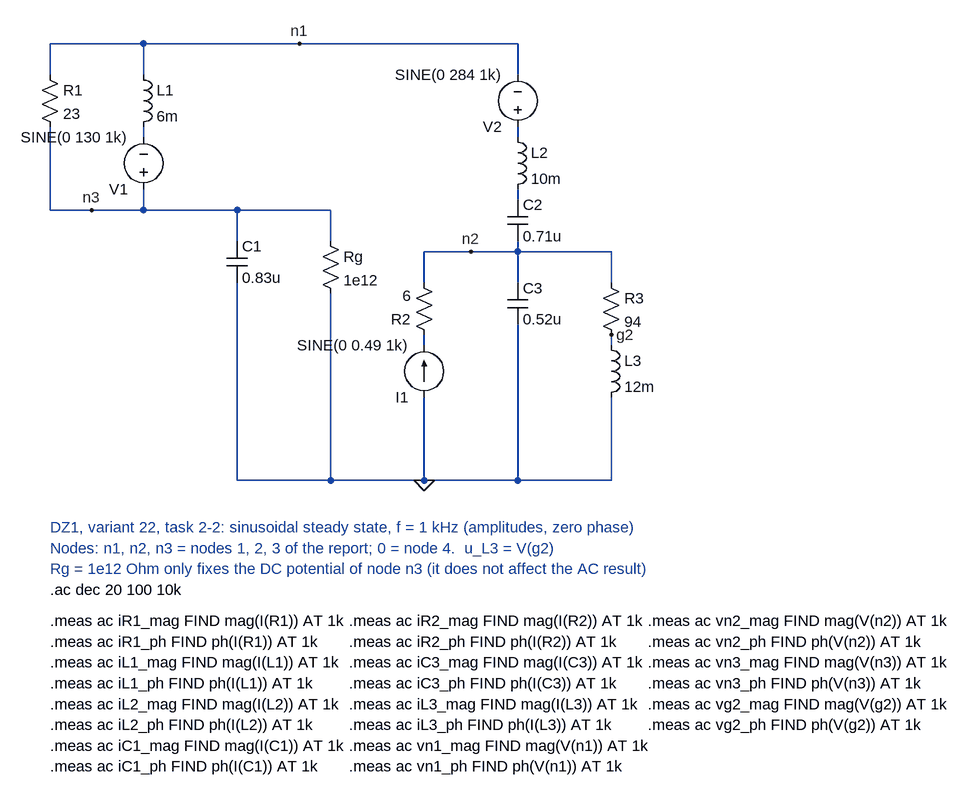
[diagram p0: schematic task22_ac_var22.asc]
task22_ac_var22.asc, the LTspice schematic file:
Version 4
SHEET 1 1500 1304
WIRE 912 128 912 176
WIRE 912 256 912 272
WIRE 912 352 912 368
WIRE 912 432 912 448
WIRE 192 128 192 176
WIRE 192 256 192 384
WIRE 336 128 336 176
WIRE 336 256 336 272
WIRE 336 352 336 384
WIRE 480 384 480 432
WIRE 480 496 480 800
WIRE 624 384 624 432
WIRE 624 512 624 800
WIRE 768 448 768 496
WIRE 768 576 768 592
WIRE 768 672 768 800
WIRE 912 448 912 496
WIRE 912 560 912 800
WIRE 1056 448 1056 496
WIRE 1056 576 1056 592
WIRE 1056 672 1056 800
WIRE 192 128 336 128
WIRE 336 128 576 128
WIRE 576 128 912 128
WIRE 192 384 256 384
WIRE 256 384 336 384
WIRE 336 384 480 384
WIRE 480 384 624 384
WIRE 768 448 840 448
WIRE 840 448 912 448
WIRE 912 448 1056 448
WIRE 480 800 624 800
WIRE 624 800 768 800
WIRE 768 800 912 800
WIRE 912 800 1056 800
FLAG 768 800 0
FLAG 576 128 n1
FLAG 256 384 n3
FLAG 840 448 n2
FLAG 1056 576 g2
SYMBOL voltage 912 272 R180
SYMATTR InstName V2
SYMATTR Value SINE(0 284 1k)
SYMATTR Value2 AC 284 0
SYMBOL ind 896 256 R0
SYMATTR InstName L2
SYMATTR Value 10m
SYMBOL cap 896 368 R0
SYMATTR InstName C2
SYMATTR Value 0.71u
SYMBOL res 176 160 R0
SYMATTR InstName R1
SYMATTR Value 23
SYMBOL ind 320 160 R0
SYMATTR InstName L1
SYMATTR Value 6m
SYMBOL voltage 336 368 R180
SYMATTR InstName V1
SYMATTR Value SINE(0 130 1k)
SYMATTR Value2 AC 130 0
SYMBOL cap 464 432 R0
SYMATTR InstName C1
SYMATTR Value 0.83u
SYMBOL res 608 416 R0
SYMATTR InstName Rg
SYMATTR Value 1e12
SYMBOL res 784 592 R180
SYMATTR InstName R2
SYMATTR Value 6
SYMBOL current 768 672 R180
SYMATTR InstName I1
SYMATTR Value SINE(0 0.49 1k)
SYMATTR Value2 AC 0.49 0
SYMBOL cap 896 496 R0
SYMATTR InstName C3
SYMATTR Value 0.52u
SYMBOL res 1040 480 R0
SYMATTR InstName R3
SYMATTR Value 94
SYMBOL ind 1040 576 R0
SYMATTR InstName L3
SYMATTR Value 12m
TEXT 192 872 Left 2 ;DZ1, variant 22, task 2-2: sinusoidal steady state, f = 1 kHz (amplitudes, zero phase)
TEXT 192 904 Left 2 ;Nodes: n1, n2, n3 = nodes 1, 2, 3 of the report; 0 = node 4.  u_L3 = V(g2)
TEXT 192 936 Left 2 ;Rg = 1e12 Ohm only fixes the DC potential of node n3 (it does not affect the AC result)
TEXT 192 968 Left 2 !.ac dec 20 100 10k
TEXT 192 1016 Left 2 !.meas ac iR1_mag FIND mag(I(R1)) AT 1k
TEXT 192 1048 Left 2 !.meas ac iR1_ph FIND ph(I(R1)) AT 1k
TEXT 192 1080 Left 2 !.meas ac iL1_mag FIND mag(I(L1)) AT 1k
TEXT 192 1112 Left 2 !.meas ac iL1_ph FIND ph(I(L1)) AT 1k
TEXT 192 1144 Left 2 !.meas ac iL2_mag FIND mag(I(L2)) AT 1k
TEXT 192 1176 Left 2 !.meas ac iL2_ph FIND ph(I(L2)) AT 1k
TEXT 192 1208 Left 2 !.meas ac iC1_mag FIND mag(I(C1)) AT 1k
TEXT 192 1240 Left 2 !.meas ac iC1_ph FIND ph(I(C1)) AT 1k
TEXT 652 1016 Left 2 !.meas ac iR2_mag FIND mag(I(R2)) AT 1k
TEXT 652 1048 Left 2 !.meas ac iR2_ph FIND ph(I(R2)) AT 1k
TEXT 652 1080 Left 2 !.meas ac iC3_mag FIND mag(I(C3)) AT 1k
TEXT 652 1112 Left 2 !.meas ac iC3_ph FIND ph(I(C3)) AT 1k
TEXT 652 1144 Left 2 !.meas ac iL3_mag FIND mag(I(L3)) AT 1k
TEXT 652 1176 Left 2 !.meas ac iL3_ph FIND ph(I(L3)) AT 1k
TEXT 652 1208 Left 2 !.meas ac vn1_mag FIND mag(V(n1)) AT 1k
TEXT 652 1240 Left 2 !.meas ac vn1_ph FIND ph(V(n1)) AT 1k
TEXT 1112 1016 Left 2 !.meas ac vn2_mag FIND mag(V(n2)) AT 1k
TEXT 1112 1048 Left 2 !.meas ac vn2_ph FIND ph(V(n2)) AT 1k
TEXT 1112 1080 Left 2 !.meas ac vn3_mag FIND mag(V(n3)) AT 1k
TEXT 1112 1112 Left 2 !.meas ac vn3_ph FIND ph(V(n3)) AT 1k
TEXT 1112 1144 Left 2 !.meas ac vg2_mag FIND mag(V(g2)) AT 1k
TEXT 1112 1176 Left 2 !.meas ac vg2_ph FIND ph(V(g2)) AT 1k

The netlist it stands for:
* task22_ac_var22.asc
V2 N001 n1 SINE(0 284 1k) AC 284 0
L2 N001 N002 10m
C2 N002 n2 0.71u
R1 n1 n3 23
L1 n1 N003 6m
V1 n3 N003 SINE(0 130 1k) AC 130 0
C1 n3 0 0.83u
Rg n3 0 1e12
R2 N004 n2 6
I1 0 N004 SINE(0 0.49 1k) AC 0.49 0
C3 n2 0 0.52u
R3 n2 g2 94
L3 g2 0 12m
* DZ1, variant 22, task 2-2: sinusoidal steady state, f = 1 kHz (amplitudes, zero phase)
* Nodes: n1, n2, n3 = nodes 1, 2, 3 of the report; 0 = node 4.  u_L3 = V(g2)
* Rg = 1e12 Ohm only fixes the DC potential of node n3 (it does not affect the AC result)
.ac dec 20 100 10k
.meas ac iR1_mag FIND mag(I(R1)) AT 1k
.meas ac iR1_ph FIND ph(I(R1)) AT 1k
.meas ac iL1_mag FIND mag(I(L1)) AT 1k
.meas ac iL1_ph FIND ph(I(L1)) AT 1k
.meas ac iL2_mag FIND mag(I(L2)) AT 1k
.meas ac iL2_ph FIND ph(I(L2)) AT 1k
.meas ac iC1_mag FIND mag(I(C1)) AT 1k
.meas ac iC1_ph FIND ph(I(C1)) AT 1k
.meas ac iR2_mag FIND mag(I(R2)) AT 1k
.meas ac iR2_ph FIND ph(I(R2)) AT 1k
.meas ac iC3_mag FIND mag(I(C3)) AT 1k
.meas ac iC3_ph FIND ph(I(C3)) AT 1k
.meas ac iL3_mag FIND mag(I(L3)) AT 1k
.meas ac iL3_ph FIND ph(I(L3)) AT 1k
.meas ac vn1_mag FIND mag(V(n1)) AT 1k
.meas ac vn1_ph FIND ph(V(n1)) AT 1k
.meas ac vn2_mag FIND mag(V(n2)) AT 1k
.meas ac vn2_ph FIND ph(V(n2)) AT 1k
.meas ac vn3_mag FIND mag(V(n3)) AT 1k
.meas ac vn3_ph FIND ph(V(n3)) AT 1k
.meas ac vg2_mag FIND mag(V(g2)) AT 1k
.meas ac vg2_ph FIND ph(V(g2)) AT 1k
.backanno
.end